# Altium project Master-Board-v2.0.PrjPcb (part 8 of 11)

## Sheet Controller-Sheet-3.SchDoc
size 420 x 297 mm; SheetNumber: 8; SheetTotal: 15
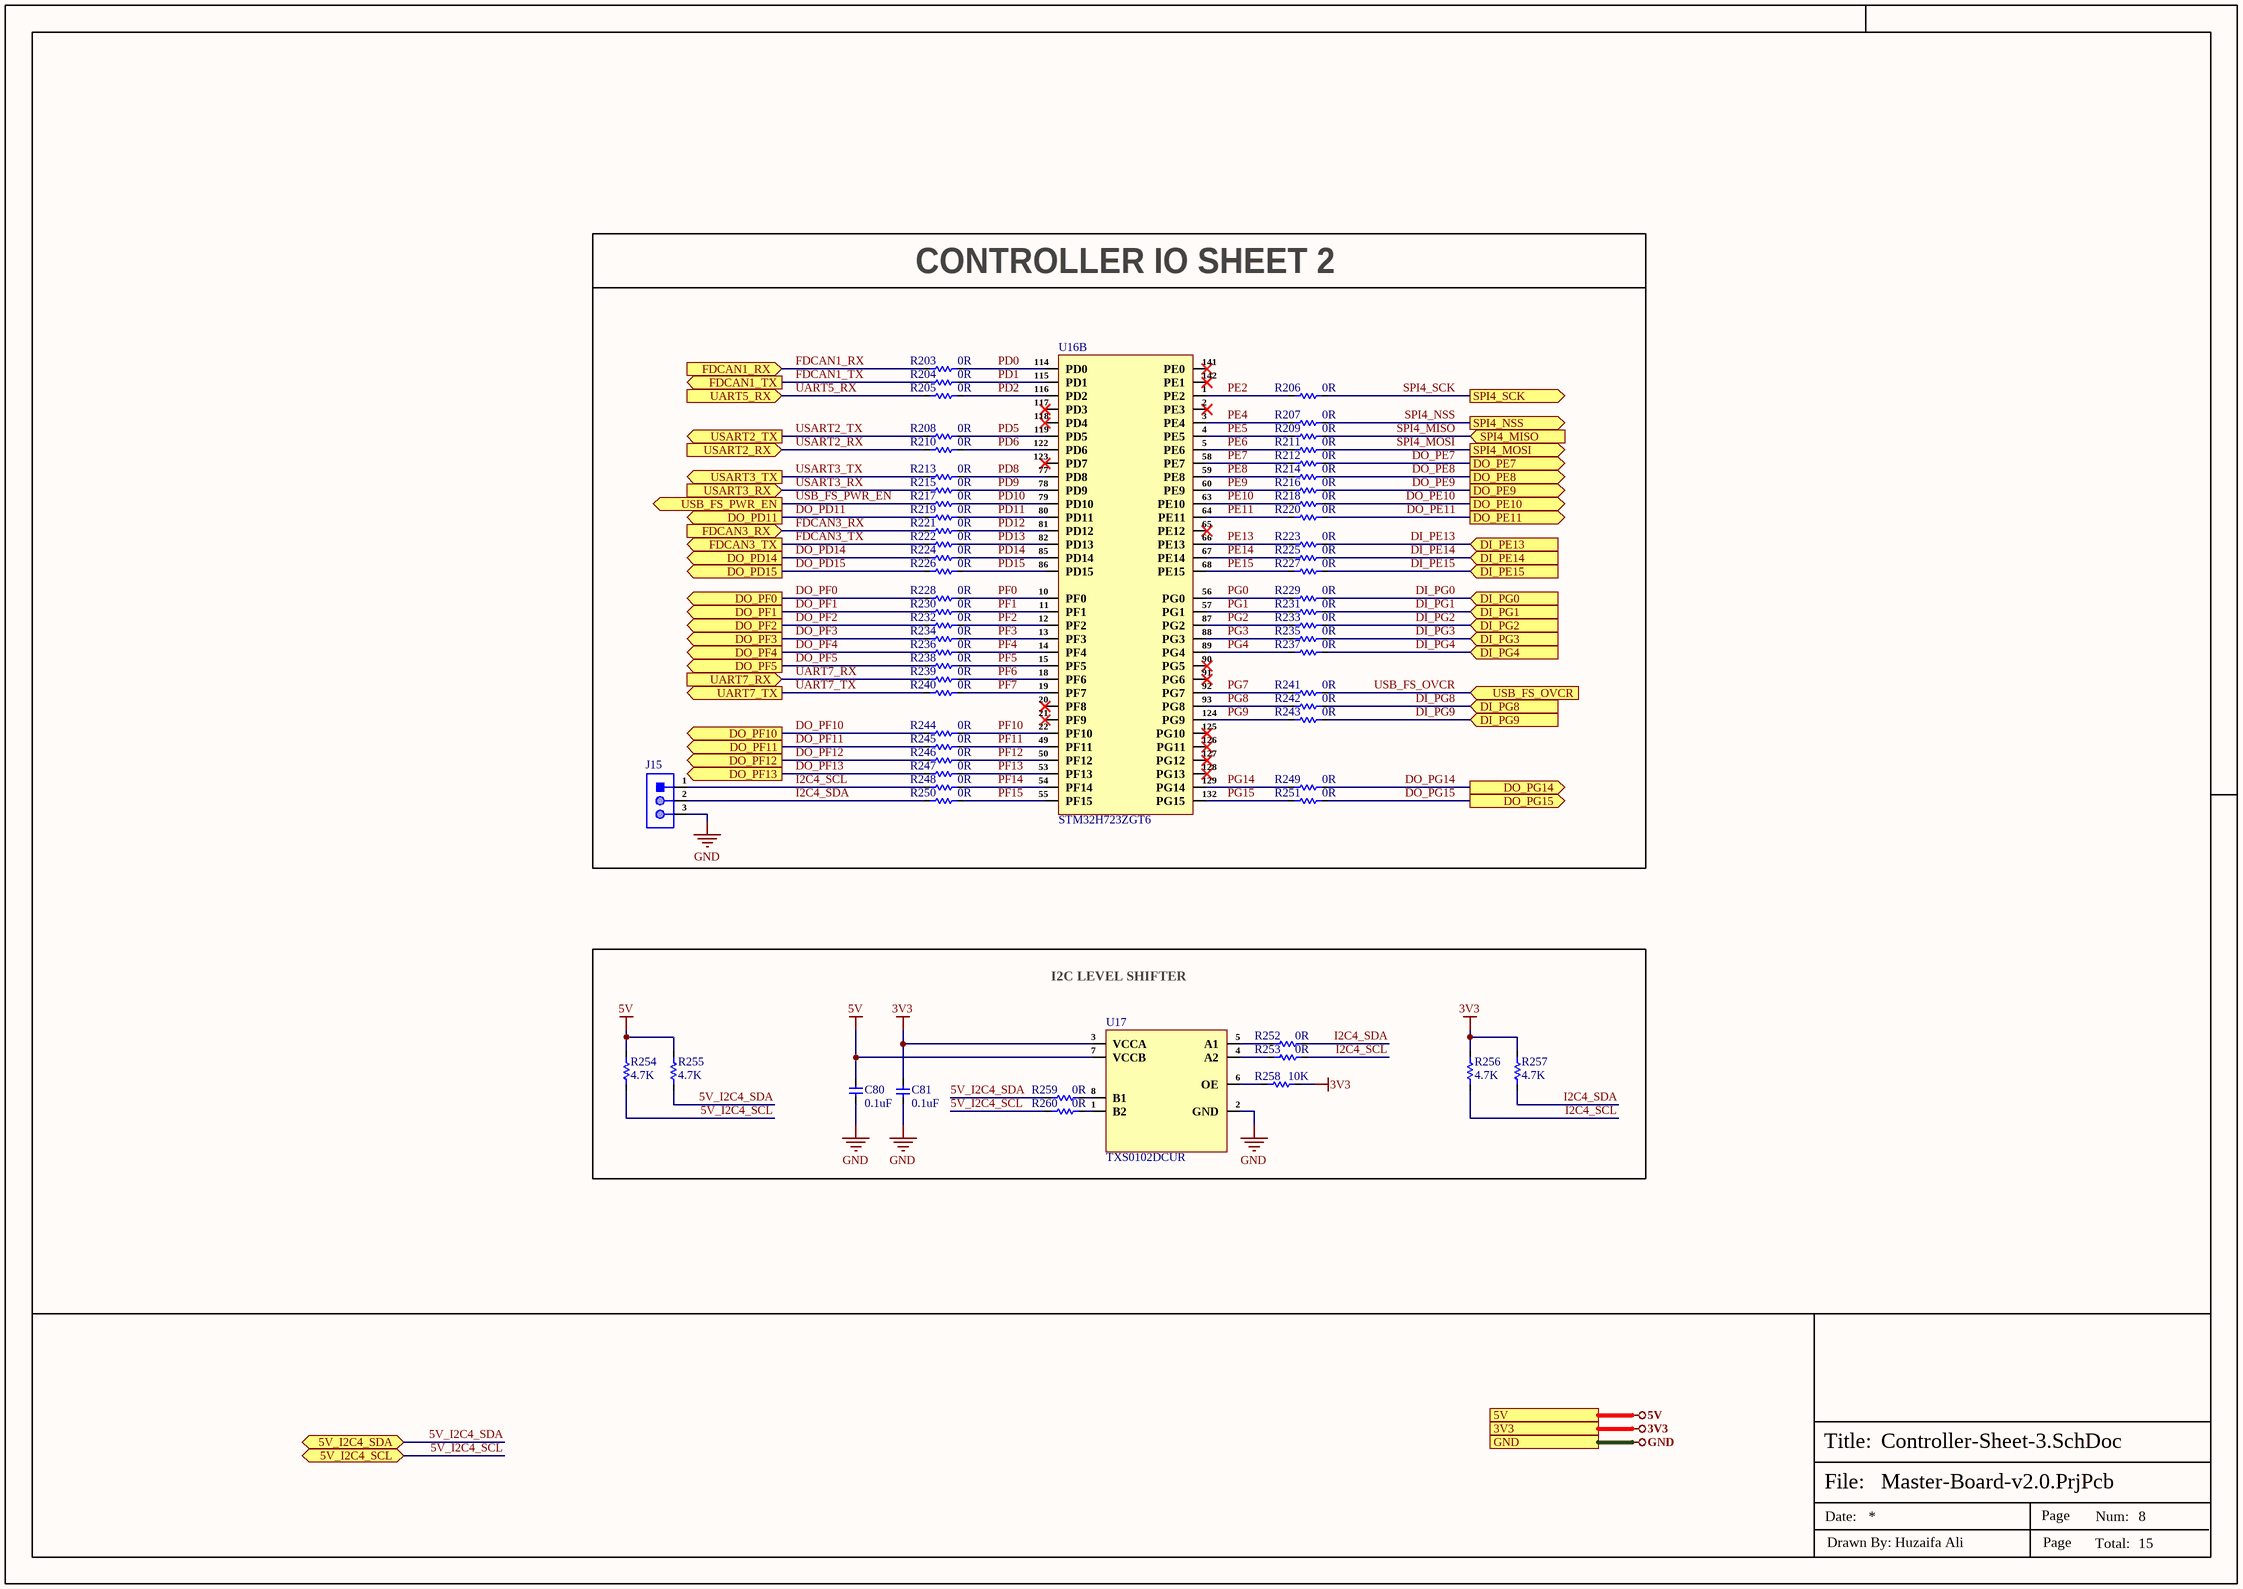
[diagram p8: Controller-Sheet-3.SchDoc]

### Parts
C80  0.1uF  [Cap-0402]
C81  0.1uF  [Cap-0402]
J15  X6511WV-03H-C60D30  [HDR1X3_]  (value not drawn)
R203  0R  [Res-0402]
R204  0R  [Res-0402]
R205  0R  [Res-0402]
R206  0R  [Res-0402]
R207  0R  [Res-0402]
R208  0R  [Res-0402]
R209  0R  [Res-0402]
R210  0R  [Res-0402]
R211  0R  [Res-0402]
R212  0R  [Res-0402]
R213  0R  [Res-0402]
R214  0R  [Res-0402]
R215  0R  [Res-0402]
R216  0R  [Res-0402]
R217  0R  [Res-0402]
R218  0R  [Res-0402]
R219  0R  [Res-0402]
R220  0R  [Res-0402]
R221  0R  [Res-0402]
R222  0R  [Res-0402]
R223  0R  [Res-0402]
R224  0R  [Res-0402]
R225  0R  [Res-0402]
R226  0R  [Res-0402]
R227  0R  [Res-0402]
R228  0R  [Res-0402]
R229  0R  [Res-0402]
R230  0R  [Res-0402]
R231  0R  [Res-0402]
R232  0R  [Res-0402]
R233  0R  [Res-0402]
R234  0R  [Res-0402]
R235  0R  [Res-0402]
R236  0R  [Res-0402]
R237  0R  [Res-0402]
R238  0R  [Res-0402]
R239  0R  [Res-0402]
R240  0R  [Res-0402]
R241  0R  [Res-0402]
R242  0R  [Res-0402]
R243  0R  [Res-0402]
R244  0R  [Res-0402]
R245  0R  [Res-0402]
R246  0R  [Res-0402]
R247  0R  [Res-0402]
R248  0R  [Res-0402]
R249  0R  [Res-0402]
R250  0R  [Res-0402]
R251  0R  [Res-0402]
R252  0R  [Res-0402]
R253  0R  [Res-0402]
R254  4.7K  [Res-0402]
R255  4.7K  [Res-0402]
R256  4.7K  [Res-0402]
R257  4.7K  [Res-0402]
R258  10K  [Res-0402]
R259  0R  [Res-0402]
R260  0R  [Res-0402]
U16  STM32H723ZGT6  [LQFP-144(20x20)]  (part B of 3)
U17  TXS0102DCUR  [VSSOP-8(3.1x2.1)]

### Blocks framed on the sheet
CONTROLLER IO SHEET 2: J15 R203-R251 U16
I2C LEVEL SHIFTER: C80 C81 R252-R260 U17

### Ports
3V3 (see Top-Sheet[3B], CAN-Sheet[5D], Controller-Sheet-1[4D], Controller-Sheet-2[4D], DIOs-Lights-Sensors-Sheet[4D], Display-Sheet[5D], ESP32_Sheet[6D], EtherCAT-Sheet[1D], Ethernet-Sheet[5D], Power-Sheet[4D], RS232-Sheet[5D], RS485-Sheet[5D], STM32-USB-Sheet[4D]), 5V (see Top-Sheet[3B], Analog-AIO-Sheet[5D], CAN-Sheet[5D], Controller-Sheet-2[4D], DIOs-Lights-Sensors-Sheet[4D], Display-Sheet[5D], Power-Sheet[4D], RS232-Sheet[5D], RS485-Sheet[5D], STM32-USB-Sheet[4D]), 5V_I2C4_SCL (bidir, see Top-Sheet[3C]), 5V_I2C4_SDA (bidir, see Top-Sheet[3C]), DI_PE13 (in, see Top-Sheet[4C]), DI_PE14 (in, see Top-Sheet[4C]), DI_PE15 (in, see Top-Sheet[4C]), DI_PG0 (in, see Top-Sheet[4C]), DI_PG1 (in, see Top-Sheet[4C]), DI_PG2 (in, see Top-Sheet[4C]), DI_PG3 (in, see Top-Sheet[4C]), DI_PG4 (in, see Top-Sheet[4C]), DI_PG8 (in, see Top-Sheet[4B]), DI_PG9 (in, see Top-Sheet[4B]), DO_PD11 (out, see Top-Sheet[4C]), DO_PD14 (out, see Top-Sheet[4C]), DO_PD15 (out, see Top-Sheet[4C]), DO_PE7 (out, see Top-Sheet[3C]), DO_PE8 (out, see Top-Sheet[3C]), DO_PE9 (out, see Top-Sheet[3C]), DO_PE10 (out, see Top-Sheet[3C]), DO_PE11 (out, see Top-Sheet[3C]), DO_PF0 (out, see Top-Sheet[3C]), DO_PF1 (out, see Top-Sheet[3C]), DO_PF2 (out, see Top-Sheet[3C]), DO_PF3 (out, see Top-Sheet[3D]), DO_PF4 (out, see Top-Sheet[3D]), DO_PF5 (out, see Top-Sheet[3D]), DO_PF10 (out, see Top-Sheet[3D]), DO_PF11 (out, see Top-Sheet[3D]), DO_PF12 (out, see Top-Sheet[3D]), DO_PF13 (out, see Top-Sheet[4C]), DO_PG14 (out, see Top-Sheet[4B]), DO_PG15 (out, see Top-Sheet[4B]), FDCAN1_RX (in, see Top-Sheet[3C]), FDCAN1_TX (out, see Top-Sheet[3C]), FDCAN3_RX (in, see Top-Sheet[3D]), FDCAN3_TX (out, see Top-Sheet[3D]), GND (see Top-Sheet[3B], Analog-AIO-Sheet[5D], CAN-Sheet[6D], Controller-Sheet-1[4D], Controller-Sheet-2[4D], DIOs-Lights-Sensors-Sheet[4D], Display-Sheet[5D], ESP32_Sheet[6D], EtherCAT-Sheet[1D], Ethernet-Sheet[5D], Power-Sheet[4D], RS232-Sheet[5D], RS485-Sheet[5D], STM32-USB-Sheet[4D]), SPI4_MISO (in, see Top-Sheet[3C]), SPI4_MOSI (out, see Top-Sheet[3B]), SPI4_NSS (out, see Top-Sheet[3B]), SPI4_SCK (out, see Top-Sheet[3B]), UART5_RX (in, see Top-Sheet[3D]), UART7_RX (in, see Top-Sheet[3B]), UART7_TX (out, see Top-Sheet[3B]), USART2_RX (in, see Top-Sheet[4B]), USART2_TX (out, see Top-Sheet[4B]), USART3_RX (in, see Top-Sheet[3D]), USART3_TX (out, see Top-Sheet[3D]), USB_FS_OVCR (in, see Top-Sheet[4C], STM32-USB-Sheet[1D]), USB_FS_PWR_EN (out, see Top-Sheet[4C], STM32-USB-Sheet[1D])

### Nets
3V3: C81.2 R256.2 R257.2 R258.2 U17.3(VCCA) ; port 3V3
5V: C80.1 R254.2 R255.2 U17.7(VCCB) ; port 5V
GND: C80.2 C81.1 J15.3 U17.2(GND) ; port GND
5V_I2C4_SCL: R254.1 R260.1 ; port 5V_I2C4_SCL
5V_I2C4_SDA: R255.1 R259.1 ; port 5V_I2C4_SDA
DI_PE13: R223.1 ; port DI_PE13
DI_PE14: R225.1 ; port DI_PE14
DI_PE15: R227.1 ; port DI_PE15
DI_PG0: R229.1 ; port DI_PG0
DI_PG1: R231.1 ; port DI_PG1
DI_PG2: R233.1 ; port DI_PG2
DI_PG3: R235.1 ; port DI_PG3
DI_PG4: R237.1 ; port DI_PG4
DI_PG8: R242.1 ; port DI_PG8  [project net CHIP_INVALID_1]
DI_PG9: R243.1 ; port DI_PG9  [project net CHIP_INVALID_2]
DO_PD11: R219.2 ; port DO_PD11
DO_PD14: R224.2 ; port DO_PD14
DO_PD15: R226.2 ; port DO_PD15  [project net BUZ_EN]
DO_PE7: R212.1 ; port DO_PE7
DO_PE8: R214.1 ; port DO_PE8
DO_PE9: R216.1 ; port DO_PE9
DO_PE10: R218.1 ; port DO_PE10
DO_PE11: R220.1 ; port DO_PE11
DO_PF0: R228.2 ; port DO_PF0  [project net CAN1_SHDN]
DO_PF1: R230.2 ; port DO_PF1  [project net CAN1_STB]
DO_PF2: R232.2 ; port DO_PF2  [project net CAN2_SHDN]
DO_PF3: R234.2 ; port DO_PF3  [project net CAN2_STB]
DO_PF4: R236.2 ; port DO_PF4  [project net CAN3_SHDN]
DO_PF5: R238.2 ; port DO_PF5  [project net CAN3_STB]
DO_PF10: R244.2 ; port DO_PF10
DO_PF11: R245.2 ; port DO_PF11
DO_PF12: R246.2 ; port DO_PF12
DO_PF13: R247.2 ; port DO_PF13
DO_PG14: R249.1 ; port DO_PG14  [project net CHIP_EN_1]
DO_PG15: R251.1 ; port DO_PG15  [project net CHIP_EN_2]
FDCAN1_RX: R203.2 ; port FDCAN1_RX  [project net CAN1_RXD]
FDCAN1_TX: R204.2 ; port FDCAN1_TX  [project net CAN1_TXD]
FDCAN3_RX: R221.2 ; port FDCAN3_RX  [project net CAN3_RXD]
FDCAN3_TX: R222.2 ; port FDCAN3_TX  [project net CAN3_TXD]
I2C4_SCL: J15.1 R248.2 R253.2 R256.1
I2C4_SDA: J15.2 R250.2 R252.2 R257.1
PD0: R203.1 U16.114(PD0)
PD1: R204.1 U16.115(PD1)
PD2: R205.1 U16.116(PD2)
PD5: R208.1 U16.119(PD5)
PD6: R210.1 U16.122(PD6)
PD8: R213.1 U16.77(PD8)
PD9: R215.1 U16.78(PD9)
PD10: R217.1 U16.79(PD10)
PD11: R219.1 U16.80(PD11)
PD12: R221.1 U16.81(PD12)
PD13: R222.1 U16.82(PD13)
PD14: R224.1 U16.85(PD14)
PD15: R226.1 U16.86(PD15)
PE2: R206.2 U16.1(PE2)
PE4: R207.2 U16.3(PE4)
PE5: R209.2 U16.4(PE5)
PE6: R211.2 U16.5(PE6)
PE7: R212.2 U16.58(PE7)
PE8: R214.2 U16.59(PE8)
PE9: R216.2 U16.60(PE9)
PE10: R218.2 U16.63(PE10)
PE11: R220.2 U16.64(PE11)
PE13: R223.2 U16.66(PE13)
PE14: R225.2 U16.67(PE14)
PE15: R227.2 U16.68(PE15)
PF0: R228.1 U16.10(PF0)
PF1: R230.1 U16.11(PF1)
PF2: R232.1 U16.12(PF2)
PF3: R234.1 U16.13(PF3)
PF4: R236.1 U16.14(PF4)
PF5: R238.1 U16.15(PF5)
PF6: R239.1 U16.18(PF6)
PF7: R240.1 U16.19(PF7)
PF10: R244.1 U16.22(PF10)
PF11: R245.1 U16.49(PF11)
PF12: R246.1 U16.50(PF12)
PF13: R247.1 U16.53(PF13)
PF14: R248.1 U16.54(PF14)
PF15: R250.1 U16.55(PF15)
PG0: R229.2 U16.56(PG0)
PG1: R231.2 U16.57(PG1)
PG2: R233.2 U16.87(PG2)
PG3: R235.2 U16.88(PG3)
PG4: R237.2 U16.89(PG4)
PG7: R241.2 U16.92(PG7)
PG8: R242.2 U16.93(PG8)
PG9: R243.2 U16.124(PG9)
PG14: R249.2 U16.129(PG14)
PG15: R251.2 U16.132(PG15)
SPI4_MISO: R209.1 ; port SPI4_MISO
SPI4_MOSI: R211.1 ; port SPI4_MOSI
SPI4_NSS: R207.1 ; port SPI4_NSS
SPI4_SCK: R206.1 ; port SPI4_SCK
UART5_RX: R205.2 ; port UART5_RX  [project net 485_ROUT_3]
UART7_RX: R239.2 ; port UART7_RX  [project net IO15]
UART7_TX: R240.2 ; port UART7_TX  [project net IO14]
USART2_RX: R210.2 ; port USART2_RX  [project net ROUT_2]
USART2_TX: R208.2 ; port USART2_TX  [project net DIN_2]
USART3_RX: R215.2 ; port USART3_RX  [project net 485_ROUT_1]
USART3_TX: R213.2 ; port USART3_TX  [project net 485_DIN_1]
USB_FS_OVCR: R241.1 ; port USB_FS_OVCR
USB_FS_PWR_EN: R217.2 ; port USB_FS_PWR_EN
NetR252_1: R252.1 U17.5(A1)
NetR253_1: R253.1 U17.4(A2)
NetR258_1: R258.1 U17.6(OE)
NetR259_2: R259.2 U17.8(B1)
NetR260_2: R260.2 U17.1(B2)

Not connected (* = marked no-connect by the designer): U16 2(PE3)* 20(PF8)* 21(PF9)* 65(PE12)* 90(PG5)* 91(PG6)* 117(PD3)* 118(PD4)* 123(PD7)* 125(PG10)* 126(PG11)* 127(PG12)* 128(PG13)* 141(PE0)* 142(PE1)*

### Notes on the sheet
- File:
- Title:
- Date:
- Page
- Num:
- Total:
- Drawn By: Huzaifa Ali

### Library data of the parts
C80 C81 = CC0402JRX7R7BB104: as C30 on sheet Display-Sheet; Supplier: Digikey; Supplier Part Number: 311-1676-1-ND; Manufacturer Part Number: CC0402JRX7R7BB104; RoHS: Yes; Category: Ceramic Capacitors; Stock: 1659111; Pricing: 1=0.1, 10=0.046, 50=0.0262, 100=0.0203, 500=0.01528, 1000=0.012, 2500=0.01091, 5000=0.01004 (USD); Mounting Technology: Surface Mount; Case/Package: 0402; Case Code (Metric): 1005; Case Code (Imperial): 0402; Min Operating Temperature: -55°C; Max Operating Temperature: 125°C; Dielectric: X7R; Packaging: Tape and Reel; Package Quantity: 10000; Voltage Rating (DC): 16V; Voltage Rating: 16V; Series: CC; Construction: Flat; Length: 0.039inch; Width: 0.02inch; Height: 0.5mm; Thickness: 0.022inch; Lead Free: Lead Free; Halogen Free: Halogen Free; RoHS Compliant: Yes; ComponentLink1URL: https://datasheet.ciiva.com/13210/upy-gphc-x7r-6-3v-to-50v-8-12304-13210152.pdf?src-supplier=Mouser; ComponentLink1Description: https://datasheet.ciiva.com/13210/upy-gphc-x7r-6-3v-to-50v-8-12304-13210152.pdf?src-supplier=Mouser; LCSC Part Number: C541464
J15 = X6511WV-03H-C60D30: Gold 250V 3A Straight Square Pins 2.5mm 3P 260℃ 6mm -40℃~+105℃ 3mm 2.54mm Plugin Black Brass 1x3P Plugin,P=2.54mm Pin Headers ROHS; Manufacturer: XKB; Item Type: Male Header; Manufacturer Part Number: X6511WV-03H-C60D30; Package: Plugin,P=2.54mm; LCSC Part Number: C706875; ComponentLink1Description: LCSC; ComponentLink1URL: https://www.lcsc.com/product-detail/Pin-Headers_XKB-Connectivity-X6511WV-03H-C60D30_C706875.html
R203-R253 R259 R260 = RC0402FR-070RL: as R77-R83 on sheet Display-Sheet; Supplier 1: Mouser; Manufacturer Part Number: RC0402FR-070RL; RoHS: Yes; Stock 1: 8556842; Pricing 1: 1=0.10000, 10=0.01400, 50=0.01400, 100=0.00600, 1000=0.00300, 5000=0.00200, 10000=0.00100 (USD); Mount: Surface Mount; Case/Package: 0402; Contact Plating: Tin,Matte; Case Code (Imperial): 0402; Case Code (Metric): 1005; Size Code: 0402; Min Operating Temperature: -55°C; Max Operating Temperature: 155°C; Resistance: 0R; Resistor Type: Thick Film; Packaging: Tape and Reel; Termination: SMD/SMT; Features: Moisture Resistant; Series: RC; Number of Terminations: 2; Length: 1mm; Width: 0.5mm; Height: 0.35mm; Radiation Hardening: No; Lead Free: Lead Free; RoHS Compliant: Yes; ComponentLink1URL: https://datasheet.ciiva.com/8896/pyu-rc0402-51-rohs-l-6-8896149.pdf?src-supplier=Avnet; ComponentLink1Description: https://datasheet.ciiva.com/8896/pyu-rc0402-51-rohs-l-6-8896149.pdf?src-supplier=Avnet; ComponentLink2URL: https://datasheet.ciiva.com/16790/pyu-rc0402-51-rohs-l-6-r-16790444.pdf?src-supplier=Future+Electronics; ComponentLink2Description: https://datasheet.ciiva.com/16790/pyu-rc0402-51-rohs-l-6-r-16790444.pdf?src-supplier=Future+Electronics; Supplier Part Number 1: 603-RC0402FR-070RL; LCSC Part Number: C106231
R254-R257 = RC0402FR-074K7L: as R389-R392 on sheet DIOs-Lights-Sensors-Sheet; Supplier 1: Avnet; Manufacturer Part Number: RC0402FR-074K7L; RoHS: Yes; Category: Chip SMD Resistors; Stock 1: 2420000; Pricing 1: 10000=0.00085 (USD); Case/Package: 0402; Number of Pins: 2; Case Code (Imperial): 0402; Case Code (Metric): 1005; Size Code: 0402; Min Operating Temperature: -55°C; Max Operating Temperature: 155°C; Tolerance: 1%; Voltage Rating: 50V; Packaging: Tape and Reel; Resistor Type: Thick Film; Termination: SMD/SMT; Features: Moisture Resistant; Series: RC; Number of Terminations: 2; Resistance Tolerance: 1%; Construction: Rectangular; Length: 1mm; Width: 0.5mm; Height: 0.32mm; Depth: 0.5mm; Height - Seated (Max): 0.016inch; RoHS Compliant: Yes; Reach SVHC Compliant: Yes; Military Standard: Not; Lead Free: Lead Free; ComponentLink1URL: https://datasheet.ciiva.com/22661/1686128-22661342.pdf?src-supplier=Element14; ComponentLink1Description: https://datasheet.ciiva.com/22661/1686128-22661342.pdf?src-supplier=Element14; ComponentLink2URL: https://datasheet.ciiva.com/7850/1018594-7850022.pdf?src-supplier=Element14; ComponentLink2Description: https://datasheet.ciiva.com/7850/1018594-7850022.pdf?src-supplier=Element14; ComponentLink3URL: https://datasheet.ciiva.com/7850/1018594-7850023.pdf?src-supplier=Element14; ComponentLink3Description: https://datasheet.ciiva.com/7850/1018594-7850023.pdf?src-supplier=Element14; ComponentLink4URL: https://datasheet.ciiva.com/15215/getdatasheetpartid-328119-15215035.pdf?src-supplier=Verical; ComponentLink4Description: https://datasheet.ciiva.com/15215/getdatasheetpartid-328119-15215035.pdf?src-supplier=Verical; Supplier Part Number 1: RC0402FR-074K7L; LCSC Part Number: C105871
R258 = RC0402FR-0710KL: as R84 on sheet Display-Sheet; Supplier 1: Mouser; Manufacturer Part Number: RC0402FR-0710KL; RoHS: Yes; Category: Chip SMD Resistors; Stock 1: 18648329; Pricing 1: 1=0.10000, 10=0.01400, 50=0.01400, 100=0.00500, 1000=0.00300, 10000=0.00200 (USD); Case/Package: 0402; Number of Pins: 2; Case Code (Imperial): 0402; Case Code (Metric): 1005; Min Operating Temperature: -55°C; Max Operating Temperature: 155°C; Resistor Type: Thick Film; Tolerance: 1%; Packaging: Tape and Reel; Voltage Rating: 50V; Termination: SMD/SMT; Working Voltage: 50V; Number of Terminations: 2; Features: Moisture Resistant; Series: RC; Resistance Tolerance: 1%; Construction: Rectangular; Length: 1mm; Width: 0.5mm; Height: 0.32mm; Depth: 0.5mm; Lead Pitch: 0.2mm; REACH SVHC: No SVHC; Lead Free: Lead Free; RoHS Compliant: Yes; Military Standard: Not; ComponentLink1URL: https://datasheet.ciiva.com/7660/38568-7660787.pdf?src-supplier=Element14; ComponentLink1Description: https://datasheet.ciiva.com/7660/38568-7660787.pdf?src-supplier=Element14; ComponentLink2URL: https://datasheet.ciiva.com/7849/1686128-7849814.pdf?src-supplier=Element14; ComponentLink2Description: https://datasheet.ciiva.com/7849/1686128-7849814.pdf?src-supplier=Element14; ComponentLink3URL: https://datasheet.ciiva.com/7983/1018594-7983486.pdf?src-supplier=Element14; ComponentLink3Description: https://datasheet.ciiva.com/7983/1018594-7983486.pdf?src-supplier=Element14; ComponentLink4URL: https://datasheet.ciiva.com/22747/1018594-22747512.pdf?src-supplier=Element14; ComponentLink4Description: https://datasheet.ciiva.com/22747/1018594-22747512.pdf?src-supplier=Element14; ComponentLink5URL: https://datasheet.ciiva.com/12667/pyu-rc0402-51-rohs-l-6-r-12667067.pdf?src-supplier=Mouser; ComponentLink5Description: https://datasheet.ciiva.com/12667/pyu-rc0402-51-rohs-l-6-r-12667067.pdf?src-supplier=Mouser; ComponentLink6URL: https://datasheet.ciiva.com/7849/1784430-7849813.pdf?src-supplier=Element14; ComponentLink6Description: https://datasheet.ciiva.com/7849/1784430-7849813.pdf?src-supplier=Element14; ComponentLink7URL: https://datasheet.ciiva.com/7849/1784430-7849815.pdf?src-supplier=Element14; ComponentLink7Description: https://datasheet.ciiva.com/7849/1784430-7849815.pdf?src-supplier=Element14; Supplier Part Number 1: 603-RC0402FR-0710KL; LCSC Part Number: C60490
U16 = STM32H723ZGT6: as U16 on sheet Controller-Sheet-2; Supplier: Future Electronics; LCSC Part Number: C730146; Manufacturer Part Number: STM32H723ZGT6; RoHS: No; Item Type: IC; Stock: 4380; Pricing: 60=7.31, 120=7.27, 180=7.25, 240=7.23, 300=7.18 (USD); Min Operating Temperature: -40°C; Max Operating Temperature: 85°C; Density: 1MB; Memory Size: 1MB; Number of Ethernet Channels: 1NUMBER; Number of UART Channels: 6NUMBER; Number of USB Channels: 1NUMBER; Height: 1.6mm
U17 = TXS0102DCUR: IC TRANSLTR BIDIRECTIONAL 8VSSOP; Manufacturer: Texas Instruments; Number of Outputs: 2NUMBER; Number of Inputs: 2; Nominal Supply Current: 14.4uA; Output Current: 1A; Min Supply Voltage: 1.65V; Max Supply Voltage: 5.5V; Data Rate: 24Mbps; Propagation Delay: 4.6ns; Logic Function: Translator; Turn-On Delay Time: 260ns; High Level Output Current: -20uA; Low Level Output Current: 1mA; Number of Circuits: 1; Supplier: Mouser; Supplier Part Number: 595-TXS0102DCUR; Manufacturer Part Number: TXS0102DCUR; RoHS: Yes; Category: Voltage Level Shifters; Stock: 149802; Pricing: 1=0.89, 10=0.739, 50=0.739, 100=0.561, 1000=0.383, 10000=0.313 (USD); Case/Package: VSSOP; Pins: 8; Weight: 0.000339oz; Min Operating Temperature: -40°C; Max Operating Temperature: 85°C; Package Quantity: 3000; Number of Channels: 2; Packaging: Tape and Reel; Number of Bits: 2; Quiescent Current: 14.4uA; Series: -; Channel Type: Bidirectional; Length: 2.3mm; Width: 2mm; Height: 900um; Thickness: 850um; Radiation Hardening: No; Reach SVHC Compliant: No; Lead Free: Lead Free; RoHS Compliant: Yes; ComponentLink1URL: https://datasheet.ciiva.com/22653/1846850-22653373.pdf?src-supplier=Farnell; ComponentLink1Description: https://datasheet.ciiva.com/22653/1846850-22653373.pdf?src-supplier=Farnell; ComponentLink2URL: https://datasheet.ciiva.com/15096/getdatasheetpartid-118249-15096172.pdf?src-supplier=Verical; ComponentLink2Description: https://datasheet.ciiva.com/15096/getdatasheetpartid-118249-15096172.pdf?src-supplier=Verical; ComponentLink3URL: https://datasheet.ciiva.com/1508/1857232-1508821.pdf?src-supplier=Element14; ComponentLink3Description: https://datasheet.ciiva.com/1508/1857232-1508821.pdf?src-supplier=Element14; ComponentLink4URL: https://datasheet.ciiva.com/28499/1863639-28499676.pdf?src-supplier=Element14; ComponentLink4Description: https://datasheet.ciiva.com/28499/1863639-28499676.pdf?src-supplier=Element14; ComponentLink5URL: https://datasheet.ciiva.com/46395/1863639-46395871.pdf?src-supplier=Element14; ComponentLink5Description: https://datasheet.ciiva.com/46395/1863639-46395871.pdf?src-supplier=Element14; ComponentLink6URL: https://datasheet.ciiva.com/1899/txs0102-1899369.pdf?src-supplier=Digikey; ComponentLink6Description: https://datasheet.ciiva.com/1899/txs0102-1899369.pdf?src-supplier=Digikey; ComponentLink7URL: https://datasheet.ciiva.com/1899/txs0102-1899368.pdf?src-supplier=Digikey; ComponentLink7Description: https://datasheet.ciiva.com/1899/txs0102-1899368.pdf?src-supplier=Digikey; ComponentLink8URL: https://datasheet.ciiva.com/1899/txs0102-1899370.pdf?src-supplier=Digikey; ComponentLink8Description: https://datasheet.ciiva.com/1899/txs0102-1899370.pdf?src-supplier=Digikey; ComponentLink9URL: https://datasheet.ciiva.com/14287/txs0102-14287516.pdf?src-supplier=Avnet; ComponentLink9Description: https://datasheet.ciiva.com/14287/txs0102-14287516.pdf?src-supplier=Avnet; ComponentLink10URL: https://datasheet.ciiva.com/14287/txs0102-14287518.pdf?src-supplier=Avnet; ComponentLink10Description: https://datasheet.ciiva.com/14287/txs0102-14287518.pdf?src-supplier=Avnet; LCSC Part Number: C53434; Item Type: IC

## Sheet Analog-AIO-Sheet.SchDoc
size 420 x 297 mm; SheetNumber: 15; SheetTotal: 15
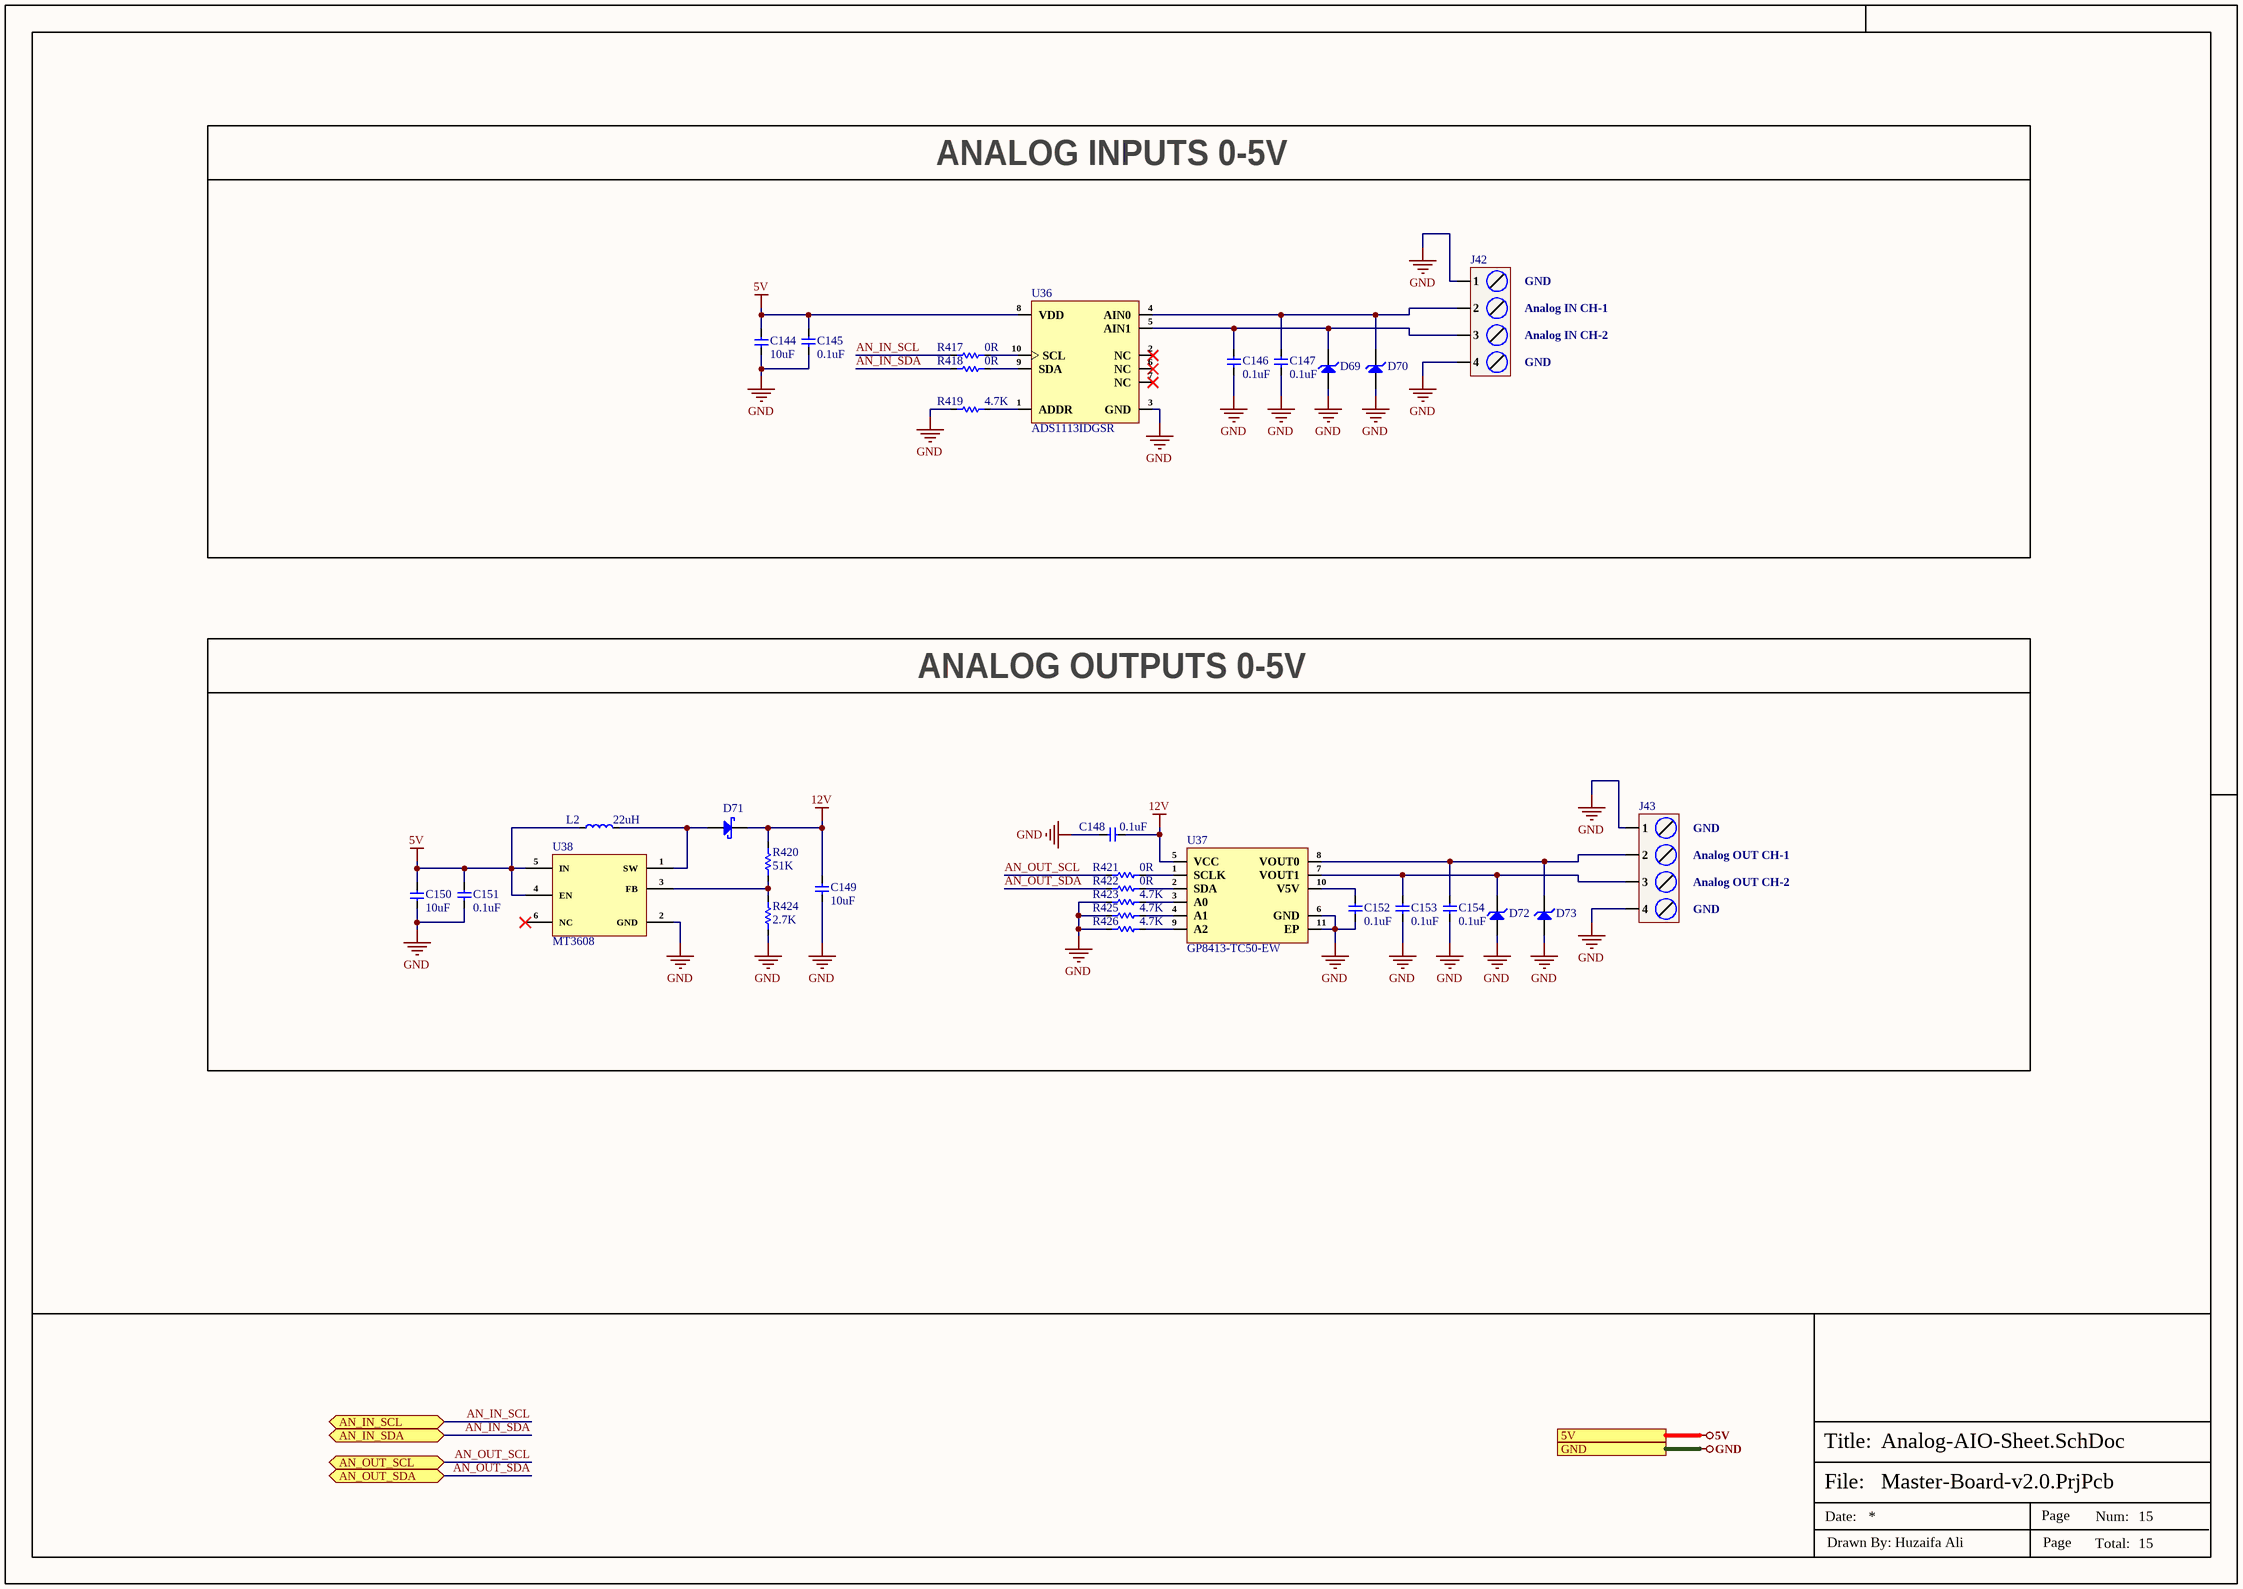
[diagram p9: Analog-AIO-Sheet.SchDoc]

### Parts
C144  10uF  [Cap-0805]
C145  0.1uF  [Cap-0402]
C146  0.1uF  [Cap-0603]
C147  0.1uF  [Cap-0603]
C148  0.1uF  [Cap-0603]
C149  10uF  [Cap-0805]
C150  10uF  [Cap-0805]
C151  0.1uF  [Cap-0402]
C152  0.1uF  [Cap-0402]
C153  0.1uF  [Cap-0603]
C154  0.1uF  [Cap-0603]
D69  AZ3005-01G  [SOD-123]  (value not drawn)
D70  AZ3005-01G  [SOD-123]  (value not drawn)
D71  1N5819HW-7-F  [SOD-123]  (value not drawn)
D72  AZ3005-01G  [SOD-123]  (value not drawn)
D73  AZ3005-01G  [SOD-123]  (value not drawn)
J42  DB128V-5.08-4P-GN-S  [DB128V-5.08-4P-GN-S]  (value not drawn)
J43  DB128V-5.08-4P-GN-S  [DB128V-5.08-4P-GN-S]  (value not drawn)
L2  22uH  [YNR4018-220M]
R417  0R  [Res-0402]
R418  0R  [Res-0402]
R419  4.7K  [Res-0402]
R420  51K  [Res-0402]
R421  0R  [Res-0402]
R422  0R  [Res-0402]
R423  4.7K  [Res-0402]
R424  2.7K  [Res-0402]
R425  4.7K  [Res-0402]
R426  4.7K  [Res-0402]
U36  ADS1113IDGSR  [VSSOP-10]
U37  GP8413-TC50-EW  [ESOP-10]
U38  MT3608  [SOT-23-6]

### Blocks framed on the sheet
ANALOG INPUTS 0-5V: C144-C147 D69 D70 J42 R417-R419 U36
ANALOG OUTPUTS 0-5V: C148-C154 D71-D73 J43 L2 R420-R426 U37 U38

### Ports
5V (see Top-Sheet[2C], CAN-Sheet[5D], Controller-Sheet-2[4D], Controller-Sheet-3[4D], DIOs-Lights-Sensors-Sheet[4D], Display-Sheet[5D], Power-Sheet[4D], RS232-Sheet[5D], RS485-Sheet[5D], STM32-USB-Sheet[4D]), AN_IN_SCL (bidir, see Top-Sheet[2C]), AN_IN_SDA (bidir, see Top-Sheet[2C]), AN_OUT_SCL (bidir, see Top-Sheet[2C]), AN_OUT_SDA (bidir, see Top-Sheet[2C]), GND (see Top-Sheet[2C], CAN-Sheet[6D], Controller-Sheet-1[4D], Controller-Sheet-2[4D], Controller-Sheet-3[4D], DIOs-Lights-Sensors-Sheet[4D], Display-Sheet[5D], ESP32_Sheet[6D], EtherCAT-Sheet[1D], Ethernet-Sheet[5D], Power-Sheet[4D], RS232-Sheet[5D], RS485-Sheet[5D], STM32-USB-Sheet[4D])

### Nets
5V: C144.2 C145.1 C150.2 C151.1 L2.1 U36.8(VDD) U38.4(EN) U38.5(IN) ; port 5V
12V: C148.1 C149.2 D71.2(K) R420.2 U37.5(VCC)
GND: C144.1 C145.2 C146.2 C147.2 C148.2 C149.1 C150.1 C151.2 C152.2 C153.2 C154.2 D69.1(A) D70.1(A) D72.1(A) D73.1(A) J42.1 J42.4 J43.1 J43.4 R419.2 R423.2 R424.1 R425.2 R426.2 U36.3(GND) U37.6(GND) U37.11(EP) U38.2(GND) ; port GND
AN_IN_SCL: R417.2 R421.2 ; port AN_IN_SCL, port AN_OUT_SCL  [also labelled AN_OUT_SCL]  [project net 5V_I2C4_SCL]
AN_IN_SDA: R418.2 R422.2 ; port AN_IN_SDA, port AN_OUT_SDA  [also labelled AN_OUT_SDA]  [project net 5V_I2C4_SDA]
NetC146_1: C146.1 D69.2(K) J42.3 U36.5(AIN1)
NetC147_1: C147.1 D70.2(K) J42.2 U36.4(AIN0)
NetC152_1: C152.1 U37.10(V5V)
NetC153_1: C153.1 D72.2(K) J43.3 U37.7(VOUT1)
NetC154_1: C154.1 D73.2(K) J43.2 U37.8(VOUT0)
NetD71_1: D71.1(A) L2.2 U38.1(SW)
NetR417_1: R417.1 U36.10(SCL)
NetR418_1: R418.1 U36.9(SDA)
NetR419_1: R419.1 U36.1(ADDR)
NetR420_1: R420.1 R424.2 U38.3(FB)
NetR421_1: R421.1 U37.1(SCLK)
NetR422_1: R422.1 U37.2(SDA)
NetR423_1: R423.1 U37.3(A0)
NetR425_1: R425.1 U37.4(A1)
NetR426_1: R426.1 U37.9(A2)

Not connected (* = marked no-connect by the designer): U36 2(NC)* 6(NC)* 7(NC)*; U38 6(NC)*

### Notes on the sheet
- Analog IN CH-1
- GND
- Analog IN CH-2
- Analog OUT CH-1
- Analog OUT CH-2
- File:
- Title:
- Date:
- Page
- Num:
- Total:
- Drawn By: Huzaifa Ali

### Library data of the parts
C144 C149 C150 = EMK212BB7106MG-T: CAP CER 10UF 16V X7R 0805; Manufacturer: Taiyo Yuden; Tolerance: 20%; Item Type: Capacitor; Supplier 1: Digi-Key; Manufacturer Part Number: EMK212BB7106MG-T; RoHS: Yes; Category: Ceramic Capacitors; Stock 1: 896107; Pricing 1: 1=0.40000, 10=0.28000, 50=0.19620, 100=0.16820, 500=0.12612, 1000=0.10650 (USD); Mount: Surface Mount; Case/Package: 0805; Case Code (Metric): 2012; Case Code (Imperial): 0805; Min Operating Temperature: -55°C; Max Operating Temperature: 125°C; Package Quantity: 3000; Packaging: Tape and Reel; Capacitance: 10uF; Voltage Rating: 16V; Voltage Rating (DC): 16V; Dielectric: X7R; Termination: SMD/SMT; Resistor Type: Ceramic; Length: 2mm; Width: 0.049inch; Height: 1.25mm; Thickness: 0.053inch; Ratings: AEC-Q200; Halogen Free: Halogen Free; RoHS Compliant: Yes; ComponentLink1URL: https://datasheet.ciiva.com/24393/472emk212bb7106mg-t-24393497.pdf?src-supplier=Onlinecomponents.com; ComponentLink1Description: https://datasheet.ciiva.com/24393/472emk212bb7106mg-t-24393497.pdf?src-supplier=Onlinecomponents.com; ComponentLink2URL: https://datasheet.ciiva.com/30229/379emk212bb7106mg-t-30229719.pdf?src-supplier=Onlinecomponents.com; ComponentLink2Description: https://datasheet.ciiva.com/30229/379emk212bb7106mg-t-30229719.pdf?src-supplier=Onlinecomponents.com; ComponentLink3URL: https://datasheet.ciiva.com/18697/mlcc-all-e-18697736.pdf?src-supplier=Digi-Key; ComponentLink3Description: https://datasheet.ciiva.com/18697/mlcc-all-e-18697736.pdf?src-supplier=Digi-Key; ComponentLink4URL: https://datasheet.ciiva.com/18697/mlcc-all-e-18697735.pdf?src-supplier=Digi-Key; ComponentLink4Description: https://datasheet.ciiva.com/18697/mlcc-all-e-18697735.pdf?src-supplier=Digi-Key; ComponentLink5URL: https://datasheet.ciiva.com/18697/mlcc-all-e-18697737.pdf?src-supplier=Digi-Key; ComponentLink5Description: https://datasheet.ciiva.com/18697/mlcc-all-e-18697737.pdf?src-supplier=Digi-Key; ComponentLink6URL: https://datasheet.ciiva.com/15376/mlcc01-e-15376088.pdf?src-supplier=Mouser; ComponentLink6Description: https://datasheet.ciiva.com/15376/mlcc01-e-15376088.pdf?src-supplier=Mouser; Supplier Part Number 1: 587-3319-1-ND; LCSC Part Number: C141287
C145 C151 C152 = CC0402JRX7R7BB104: as C30 on sheet Display-Sheet; Supplier: Digikey; Supplier Part Number: 311-1676-1-ND; Manufacturer Part Number: CC0402JRX7R7BB104; RoHS: Yes; Category: Ceramic Capacitors; Stock: 1659111; Pricing: 1=0.1, 10=0.046, 50=0.0262, 100=0.0203, 500=0.01528, 1000=0.012, 2500=0.01091, 5000=0.01004 (USD); Mounting Technology: Surface Mount; Case/Package: 0402; Case Code (Metric): 1005; Case Code (Imperial): 0402; Min Operating Temperature: -55°C; Max Operating Temperature: 125°C; Dielectric: X7R; Packaging: Tape and Reel; Package Quantity: 10000; Voltage Rating (DC): 16V; Voltage Rating: 16V; Series: CC; Construction: Flat; Length: 0.039inch; Width: 0.02inch; Height: 0.5mm; Thickness: 0.022inch; Lead Free: Lead Free; Halogen Free: Halogen Free; RoHS Compliant: Yes; ComponentLink1URL: https://datasheet.ciiva.com/13210/upy-gphc-x7r-6-3v-to-50v-8-12304-13210152.pdf?src-supplier=Mouser; ComponentLink1Description: https://datasheet.ciiva.com/13210/upy-gphc-x7r-6-3v-to-50v-8-12304-13210152.pdf?src-supplier=Mouser; LCSC Part Number: C541464
C146-C148 C153 C154 = CL10B104KB8WPNC: CAP CER 0.1UF 50V X7R 0603; Item Type: Capacitor; Material: 4241ConductorMaterial; Value: 100nF; Tolerance: 10%; LCSC Part Number: C307348; ComponentLink1Description: LCSC; Supplier: Rs; Supplier Part Number: 2575919; RoHS: Yes; Category: Ceramic Capacitors; Stock: 400; Pricing: 100=0.021, 500=0.019, 1000=0.015, 2000=0.01 (GBP); Mounting Technology: Surface Mount; Case/Package: 0603; Case Code (Metric): 1608; Case Code (Imperial): 0603; Min Operating Temperature: -55°C; Max Operating Temperature: 125°C; Packaging: Cut Tape; Voltage Rating: 50V; Series: CL; Voltage Rating (DC): 50V; Height: 900um; Ratings: AEC-Q200; RoHS Compliant: Yes; Lead Free: 5697LeadFree; ComponentLink2URL: http://www.farnell.com/datasheets/2710560.pdf?src-supplier=Farnell; ComponentLink2Description: http://www.farnell.com/datasheets/2710560.pdf?src-supplier=Farnell; ComponentLink3URL: http://www.samsungsem.com/kr/support/product-search/mlcc/CL10B104KB8WPNC.jsp?src-supplier=Digi-Key; ComponentLink3Description: http://www.samsungsem.com/kr/support/product-search/mlcc/CL10B104KB8WPNC.jsp?src-supplier=Digi-Key; ComponentLink4URL: http://www.farnell.com/datasheets/2710560.pdf?src-supplier=Element14; ComponentLink4Description: http://www.farnell.com/datasheets/2710560.pdf?src-supplier=Element14; ComponentLink5URL: https://datasheet.octopart.com/CL10B104KB8WPNC-Samsung-Electro-Mechanics-datasheet-120093645.pdf?src-supplier=Future+Electronics; ComponentLink5Description: https://datasheet.octopart.com/CL10B104KB8WPNC-Samsung-Electro-Mechanics-datasheet-120093645.pdf?src-supplier=Future+Electronics; ComponentLink6URL: http://www.farnell.com/datasheets/2710560.pdf?src-supplier=Newark; ComponentLink6Description: http://www.farnell.com/datasheets/2710560.pdf?src-supplier=Newark; ComponentLink7URL: http://www.samsungsem.com/servlet/FileDownload?type=spec&file=CL10B104KB8WPNC.pdf&src-supplier=Avnet; ComponentLink7Description: http://www.samsungsem.com/servlet/FileDownload?type=spec&file=CL10B104KB8WPNC.pdf&src-supplier=Avnet; ComponentLink8URL: https://datasheet.octopart.com/CL10B104KB8WPNC-Samsung-datasheet-8326407.pdf?src-supplier=TME; ComponentLink8Description: https://datasheet.octopart.com/CL10B104KB8WPNC-Samsung-datasheet-8326407.pdf?src-supplier=TME
D69 D70 D72 D73 = AZ3005-01G: 6V 5V SOD-123 ESD and Surge Protection (TVS/ESD) ROHS; Manufacturer: AMAZING; Manufacturer Part Number: AZ3005-01G; Package: SOD-123; LCSC Part Number: C7079241; Item Type: (TVS/ESD); ComponentLink1Description: LCSC; ComponentLink1URL: https://www.lcsc.com/product-detail/ESD-and-Surge-Protection-TVS-ESD_AMAZING-AZ3005-01G_C7079241.html
D71 = 1N5819HW-7-F: DIODE SCHOTTKY 40V 1A SOD123; Manufacturer: Diodes; Forward Voltage: 450mV; Max Reverse Current: 50uA; Element Configuration: Single; Max Forward Surge Current (Ifsm): 25A; Max Power Dissipation: 450mW; Polarity: Standard; Capacitance: 110pF; Supplier 1: Digi-Key; Manufacturer Part Number: 1N5819HW-7-F; RoHS: Yes; Category: Schottky Diodes; Pricing 1: 1=0.46000, 10=0.34500, 100=0.19530, 500=0.12936, 1000=0.09918 (USD); Case/Package: SOD-123-2; Number of Pins: 2; Weight: 0.000353oz; Contact Plating: Tin,Matte; Min Operating Temperature: -65°C; Max Operating Temperature: 125°C; Forward Current: 1A; Max Repetitive Reverse Voltage (Vrrm): 40V; Packaging: Tape and Reel; Peak Non-Repetitive Surge Current: 25A; Package Quantity: 3000; Average Rectified Current: 1A; Termination: SMD/SMT; Voltage Rating (DC): 40V; Current Rating: 1A; Output Current: 1A; Max Reverse Voltage (DC): 40V; Series: -; Length: 2.85mm; Width: 1.7mm; Height: 1.25mm; Radiation Hardening: No; RoHS Compliant: Yes; REACH SVHC: No SVHC; Lead Free: Lead Free; ComponentLink1URL: https://datasheet.ciiva.com/16303/ds30217-16303296.pdf?src-supplier=Future+Electronics; ComponentLink1Description: https://datasheet.ciiva.com/16303/ds30217-16303296.pdf?src-supplier=Future+Electronics; ComponentLink2URL: https://datasheet.ciiva.com/27092/1538419-27092484.pdf?src-supplier=Jameco; ComponentLink2Description: https://datasheet.ciiva.com/27092/1538419-27092484.pdf?src-supplier=Jameco; ComponentLink3URL: https://datasheet.ciiva.com/912/ds30217-912801.pdf?src-supplier=Digi-Key; ComponentLink3Description: https://datasheet.ciiva.com/912/ds30217-912801.pdf?src-supplier=Digi-Key; ComponentLink4URL: https://datasheet.ciiva.com/1177/ds30217-1177089.pdf?src-supplier=Element14; ComponentLink4Description: https://datasheet.ciiva.com/1177/ds30217-1177089.pdf?src-supplier=Element14; ComponentLink5URL: https://datasheet.ciiva.com/912/ds30217-912802.pdf?src-supplier=Digi-Key; ComponentLink5Description: https://datasheet.ciiva.com/912/ds30217-912802.pdf?src-supplier=Digi-Key; ComponentLink6URL: https://datasheet.ciiva.com/912/ds30217-912803.pdf?src-supplier=Digi-Key; ComponentLink6Description: https://datasheet.ciiva.com/912/ds30217-912803.pdf?src-supplier=Digi-Key; ComponentLink7URL: https://datasheet.ciiva.com/8303/ds30217-8303132.pdf?src-supplier=Avnet; ComponentLink7Description: https://datasheet.ciiva.com/8303/ds30217-8303132.pdf?src-supplier=Avnet; ComponentLink8URL: https://datasheet.ciiva.com/25919/ds30217-25919644.pdf?src-supplier=Avnet+Europe; ComponentLink8Description: https://datasheet.ciiva.com/25919/ds30217-25919644.pdf?src-supplier=Avnet+Europe; Supplier Part Number 1: 1N5819HW-FDICT-ND; LCSC Part Number: C82544; Item Type: Diode
J42 J43 = DB128V-5.08-4P-GN-S: 1x4P 20A -40℃~+105℃ 300V Green 12~30 Straight 5.08mm 2.5 1 4 Plugin,P=5.08mm Screw terminal ROHS; Manufacturer: DORABO; Manufacturer Part Number: DB128V-5.08-4P-GN-S; Package: Plugin,P=5.08mm; LCSC Part Number: C2915641; Item Type: Screw terminal; ComponentLink1Description: LCSC; ComponentLink1URL: https://www.lcsc.com/product-detail/Screw-terminal_DORABO-DB128V-5-08-4P-GN-S_C2915641.html
L2 = YNR4018-220M: 590mA 22uH ±20% SMD,4x4x1.8mm Power Inductors ROHS; Manufacturer: YJYCOIN; Manufacturer Part Number: YNR4018-220M; Package: SMD,4x4x1.8mm; LCSC Part Number: C340373; Item Type: Inductor; ComponentLink1Description: LCSC; ComponentLink1URL: https://www.lcsc.com/product-detail/Power-Inductors_YJYCOIN-YNR4018-220M_C340373.html
R417 R418 R421 R422 = RC0402FR-070RL: as R77-R83 on sheet Display-Sheet; Supplier 1: Mouser; Manufacturer Part Number: RC0402FR-070RL; RoHS: Yes; Stock 1: 8556842; Pricing 1: 1=0.10000, 10=0.01400, 50=0.01400, 100=0.00600, 1000=0.00300, 5000=0.00200, 10000=0.00100 (USD); Mount: Surface Mount; Case/Package: 0402; Contact Plating: Tin,Matte; Case Code (Imperial): 0402; Case Code (Metric): 1005; Size Code: 0402; Min Operating Temperature: -55°C; Max Operating Temperature: 155°C; Resistance: 0R; Resistor Type: Thick Film; Packaging: Tape and Reel; Termination: SMD/SMT; Features: Moisture Resistant; Series: RC; Number of Terminations: 2; Length: 1mm; Width: 0.5mm; Height: 0.35mm; Radiation Hardening: No; Lead Free: Lead Free; RoHS Compliant: Yes; ComponentLink1URL: https://datasheet.ciiva.com/8896/pyu-rc0402-51-rohs-l-6-8896149.pdf?src-supplier=Avnet; ComponentLink1Description: https://datasheet.ciiva.com/8896/pyu-rc0402-51-rohs-l-6-8896149.pdf?src-supplier=Avnet; ComponentLink2URL: https://datasheet.ciiva.com/16790/pyu-rc0402-51-rohs-l-6-r-16790444.pdf?src-supplier=Future+Electronics; ComponentLink2Description: https://datasheet.ciiva.com/16790/pyu-rc0402-51-rohs-l-6-r-16790444.pdf?src-supplier=Future+Electronics; Supplier Part Number 1: 603-RC0402FR-070RL; LCSC Part Number: C106231
R419 R423 R425 R426 = RC0402FR-074K7L: as R389-R392 on sheet DIOs-Lights-Sensors-Sheet; Supplier 1: Avnet; Manufacturer Part Number: RC0402FR-074K7L; RoHS: Yes; Category: Chip SMD Resistors; Stock 1: 2420000; Pricing 1: 10000=0.00085 (USD); Case/Package: 0402; Number of Pins: 2; Case Code (Imperial): 0402; Case Code (Metric): 1005; Size Code: 0402; Min Operating Temperature: -55°C; Max Operating Temperature: 155°C; Tolerance: 1%; Voltage Rating: 50V; Packaging: Tape and Reel; Resistor Type: Thick Film; Termination: SMD/SMT; Features: Moisture Resistant; Series: RC; Number of Terminations: 2; Resistance Tolerance: 1%; Construction: Rectangular; Length: 1mm; Width: 0.5mm; Height: 0.32mm; Depth: 0.5mm; Height - Seated (Max): 0.016inch; RoHS Compliant: Yes; Reach SVHC Compliant: Yes; Military Standard: Not; Lead Free: Lead Free; ComponentLink1URL: https://datasheet.ciiva.com/22661/1686128-22661342.pdf?src-supplier=Element14; ComponentLink1Description: https://datasheet.ciiva.com/22661/1686128-22661342.pdf?src-supplier=Element14; ComponentLink2URL: https://datasheet.ciiva.com/7850/1018594-7850022.pdf?src-supplier=Element14; ComponentLink2Description: https://datasheet.ciiva.com/7850/1018594-7850022.pdf?src-supplier=Element14; ComponentLink3URL: https://datasheet.ciiva.com/7850/1018594-7850023.pdf?src-supplier=Element14; ComponentLink3Description: https://datasheet.ciiva.com/7850/1018594-7850023.pdf?src-supplier=Element14; ComponentLink4URL: https://datasheet.ciiva.com/15215/getdatasheetpartid-328119-15215035.pdf?src-supplier=Verical; ComponentLink4Description: https://datasheet.ciiva.com/15215/getdatasheetpartid-328119-15215035.pdf?src-supplier=Verical; Supplier Part Number 1: RC0402FR-074K7L; LCSC Part Number: C105871
R420 = AT0402BRD0751KL: RES 51K OHM 0.1% 1/16W 0402; Manufacturer: Yageo; Item Type: Resistor; Supplier: Digikey; Supplier Part Number: 13-AT0402BRD0751KLTR-ND; Manufacturer Part Number: AT0402BRD0751KL; RoHS: Yes; Pricing: 10000=0.08359 (USD); LCSC Part Number: C5455493
R424 = RC0402FR-072K7L: RES 2.7K OHM 1% 1/16W 0402; Item Type: Resistor; Value: 2.7kR; Power Rating: 62.5mW; Voltage Rating: 50V; Temperature Coefficient: 100ppm/°C; Max Power Dissipation: 63mW; LCSC Part Number: C138017; ComponentLink1Description: LCSC; Supplier: Future Electronics; Supplier Part Number: 3672441; RoHS: Yes; Category: Chip SMD Resistors; Stock: 490000; Pricing: 10000=0.0009, 50000=0.0008, 300000=0.0008, 1000000=0.0007, 3000000=0.0007 (USD); Case/Package: 0402; Case Code (Imperial): 0402; Case Code (Metric): 1005; Min Operating Temperature: -55°C; Max Operating Temperature: 155°C; Tolerance: 1%; Packaging: Tape and Reel; Package Quantity: 1; Termination: SMD/SMT; Resistor Type: Thick Film; Number of Terminations: 2; Features: Moisture Resistant; Series: RC; Construction: Rectangular; Resistance Tolerance: 1%; Voltage Rating (AC): 50V; Length: 0.039inch; Width: 0.02inch; Height: 0.016inch; Depth: 0.5mm; Military Standard: Not; Lead Free: Lead Free; RoHS Compliant: Yes; Reach SVHC Compliant: Unknown; ComponentLink2URL: https://datasheet.ciiva.com/2519/pyu-r-int-thick-7-2519163.pdf?src-supplier=Digi-Key; ComponentLink2Description: https://datasheet.ciiva.com/2519/pyu-r-int-thick-7-2519163.pdf?src-supplier=Digi-Key; ComponentLink3URL: https://datasheet.ciiva.com/2519/pyu-r-int-thick-7-2519164.pdf?src-supplier=Digi-Key; ComponentLink3Description: https://datasheet.ciiva.com/2519/pyu-r-int-thick-7-2519164.pdf?src-supplier=Digi-Key; ComponentLink4URL: https://datasheet.ciiva.com/2519/pyu-r-int-thick-7-2519162.pdf?src-supplier=Digi-Key; ComponentLink4Description: https://datasheet.ciiva.com/2519/pyu-r-int-thick-7-2519162.pdf?src-supplier=Digi-Key; ComponentLink5URL: https://datasheet.ciiva.com/12656/pyu-rc0402-51-rohs-l-6-r-12656777.pdf?src-supplier=Mouser; ComponentLink5Description: https://datasheet.ciiva.com/12656/pyu-rc0402-51-rohs-l-6-r-12656777.pdf?src-supplier=Mouser; ComponentLink6URL: https://datasheet.ciiva.com/7849/1018594-7849932.pdf?src-supplier=Element14; ComponentLink6Description: https://datasheet.ciiva.com/7849/1018594-7849932.pdf?src-supplier=Element14; ComponentLink7URL: https://datasheet.ciiva.com/7849/1018594-7849933.pdf?src-supplier=Element14; ComponentLink7Description: https://datasheet.ciiva.com/7849/1018594-7849933.pdf?src-supplier=Element14
U36 = ADS1113IDGSR: IC ADC 16BIT SIGMA-DELTA 10VSSOP; Manufacturer: Texas Instruments; Supplier: Mouser; LCSC Part Number: C477969; Manufacturer Part Number: ADS1113IDGSR; RoHS: Yes; Item Type: IC; Stock: 1566; Pricing: 1=4.73, 10=3.6, 50=3.31, 100=2.87, 1000=2.75, 10000=2.11 (USD); Length: 3mm; Width: 3mm; Height: 1.07mm; Thickness: 1.02mm; Lead Free: 5697LeadFree; ComponentLink1URL: https://datasheet.ciiva.com/14260/sbas444b-14260060.pdf?src-supplier=Avnet; ComponentLink1Description: https://datasheet.ciiva.com/14260/sbas444b-14260060.pdf?src-supplier=Avnet; ComponentLink2URL: https://datasheet.ciiva.com/1303/ads1113-1303671.pdf?src-supplier=Digikey; ComponentLink2Description: https://datasheet.ciiva.com/1303/ads1113-1303671.pdf?src-supplier=Digikey
U37 = GP8413-TC50-EW: I2C ESOP-10 Digital to Analog Converters (DAC) ROHS; Manufacturer: Guestgood; Item Type: IC; Manufacturer Part Number: GP8413-TC50-EW; Package: ESOP-10; LCSC Part Number: C5464816; ComponentLink1Description: LCSC; ComponentLink1URL: https://www.lcsc.com/product-detail/Digital-to-Analog-Converters-DAC_Guestgood-GP8413-TC50-EW_C5464816.html
U38 = MT3608: boost converterType 1 Boost 28V 2V~24V 1.2MHz SOT-23-6 DC-DC Converters ROHS; Manufacturer: XI'AN Aerosemi Tech; Item Type: IC; Manufacturer Part Number: MT3608; Package: SOT-23-6; LCSC Part Number: C84817; ComponentLink1Description: LCSC; ComponentLink1URL: https://www.lcsc.com/product-detail/DC-DC-Converters_XI-AN-Aerosemi-Tech-MT3608_C84817.html